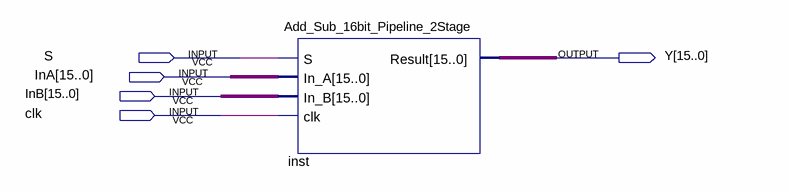
[diagram p0: schematic sheet]
// Quartus schematic test_au_2stage.bdf as structural Verilog: 1 symbols, 5 pins
module test_au_2stage (
  input  S,
  input  [15:0] InA,
  input  [15:0] InB,
  input  clk,
  output [15:0] Y
);

  Add_Sub_16bit_Pipeline_2Stage inst (.S(S), .In_A(InA), .In_B(InB), .clk(clk), .Result(Y));
endmodule
